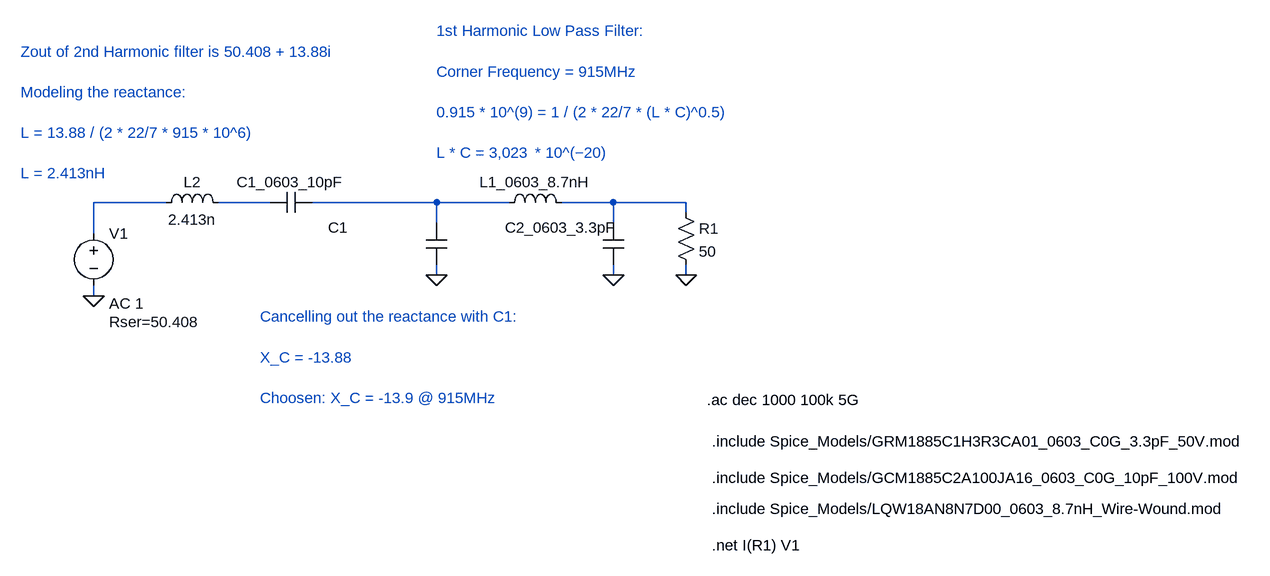
[diagram p0: schematic 1st_Harmonic_Low_Pass_Filter_Real.asc]
1st_Harmonic_Low_Pass_Filter_Real.asc, the LTspice schematic file:
Version 4.1
SHEET 1 1660 680
WIRE -48 64 -160 64
WIRE 112 64 32 64
WIRE 368 64 176 64
WIRE 480 64 368 64
WIRE 640 64 560 64
WIRE 752 64 640 64
WIRE 752 80 752 64
WIRE 368 96 368 64
WIRE 640 96 640 64
WIRE -160 112 -160 64
WIRE 368 176 368 160
WIRE 640 176 640 160
WIRE 752 176 752 160
WIRE -160 208 -160 192
FLAG 640 176 0
FLAG -160 208 0
FLAG 752 176 0
FLAG 368 176 0
SYMBOL voltage -160 96 R0
WINDOW 123 24 124 Left 2
WINDOW 39 24 152 Left 2
SYMATTR Value2 AC 1
SYMATTR SpiceLine Rser=50.408
SYMATTR InstName V1
SYMATTR Value ""
SYMBOL ind 464 80 R270
WINDOW 0 32 56 VTop 2
WINDOW 3 5 56 Invisible 2
SYMATTR InstName L1_0603_8.7nH
SYMATTR Value LQW18AN8N7D00
SYMATTR SpiceLine Rser=1m
SYMATTR Prefix X
SYMBOL cap 176 48 R90
WINDOW 0 0 32 VBottom 2
WINDOW 3 32 32 Invisible 2
SYMATTR InstName C1_0603_10pF
SYMATTR Value GCM1885C2A100JA16_DC0V_25degC
SYMATTR Prefix X
SYMBOL cap 624 96 R0
WINDOW 0 -151 7 Left 2
WINDOW 3 24 56 Invisible 2
SYMATTR InstName C2_0603_3.3pF
SYMATTR Value GRM1885C1H3R3CA01_DC0V_25degC
SYMATTR Prefix X
SYMBOL res 736 64 R0
SYMATTR InstName R1
SYMATTR Value 50
SYMBOL ind -64 80 R270
WINDOW 0 32 56 VTop 2
WINDOW 3 5 56 VBottom 2
SYMATTR InstName L2
SYMATTR Value 2.413n
SYMATTR SpiceLine Rser=1m
SYMBOL cap 352 96 R0
WINDOW 0 -151 7 Left 2
WINDOW 3 24 56 Invisible 2
SYMATTR InstName C1
SYMATTR Value GRM1885C1H3R3CA01_DC0V_25degC
SYMATTR Prefix X
TEXT 784 368 Left 2 !.ac dec 1000 100k 5G
TEXT -272 -168 Left 2 ;Zout of 2nd Harmonic filter is 50.408 + 13.88i\n \nModeling the reactance:\n \nL = 13.88 / (2 * 22/7 * 915 * 10^6)\n \nL = 2.413nH
TEXT 96 240 Left 2 ;Cancelling out the reactance with C1:\n \nX_C = -13.88\n \nChoosen: X_C = -13.9 @ 915MHz
TEXT 792 432 Left 2 !.include Spice_Models/GRM1885C1H3R3CA01_0603_C0G_3.3pF_50V.mod
TEXT 792 488 Left 2 !.include Spice_Models/GCM1885C2A100JA16_0603_C0G_10pF_100V.mod
TEXT 792 536 Left 2 !.include Spice_Models/LQW18AN8N7D00_0603_8.7nH_Wire-Wound.mod
TEXT 792 592 Left 2 !.net I(R1) V1
TEXT 368 -200 Left 2 ;1st Harmonic Low Pass Filter:\n \nCorner Frequency = 915MHz\n \n0.915 * 10^(9) = 1 / (2 * 22/7 * (L * C)^0.5)\n \nL * C = 3,023  * 10^(−20)

The netlist it stands for:
* 1st_Harmonic_Low_Pass_Filter_Real.asc
V1 N001 0 AC 1 Rser=50.408
X§L1_0603_8.7nH N003 N004 LQW18AN8N7D00 Rser=1m  ; pins A B
X§C1_0603_10pF N003 N002 GCM1885C2A100JA16_DC0V_25degC  ; pins A B
X§C2_0603_3.3pF N004 0 GRM1885C1H3R3CA01_DC0V_25degC  ; pins A B
R1 N004 0 50
L2 N001 N002 2.413n Rser=1m
X§C1 N003 0 GRM1885C1H3R3CA01_DC0V_25degC  ; pins A B
.ac dec 1000 100k 5G
* Zout of 2nd Harmonic filter is 50.408 + 13.88i
* Modeling the reactance:
* L = 13.88 / (2 * 22/7 * 915 * 10^6)
* L = 2.413nH
* Cancelling out the reactance with C1:
* X_C = -13.88
* Choosen: X_C = -13.9 @ 915MHz
.include Spice_Models/GRM1885C1H3R3CA01_0603_C0G_3.3pF_50V.mod
.include Spice_Models/GCM1885C2A100JA16_0603_C0G_10pF_100V.mod
.include Spice_Models/LQW18AN8N7D00_0603_8.7nH_Wire-Wound.mod
.net I(R1) V1
* 1st Harmonic Low Pass Filter:
* Corner Frequency = 915MHz
* 0.915 * 10^(9) = 1 / (2 * 22/7 * (L * C)^0.5)
* L * C = 3,023  * 10^(−20)
.backanno
.end